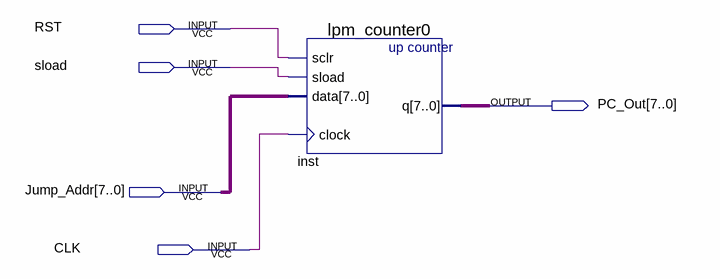
[diagram p0: schematic sheet]
// Quartus schematic Pc_counter_cpu_demo.bdf as structural Verilog: 1 symbols, 5 pins
module Pc_counter_cpu_demo (
  input  RST,
  input  sload,
  input  [7:0] Jump_Addr,
  input  CLK,
  output [7:0] PC_Out
);

  lpm_counter0 inst (.sclr(RST), .sload(sload), .data(Jump_Addr), .clock(CLK), .q(PC_Out));
endmodule
